# Altium schematic sheet Zasilanie_CLKDistribution.SchDoc: Zasilanie sygnału zegarowego
size A3; Organization: Altium Limited; Address1: L3, 12a Rodborough Rd; Address2: Frenchs Forest; Address3: NSW; Address4: Australia 2086
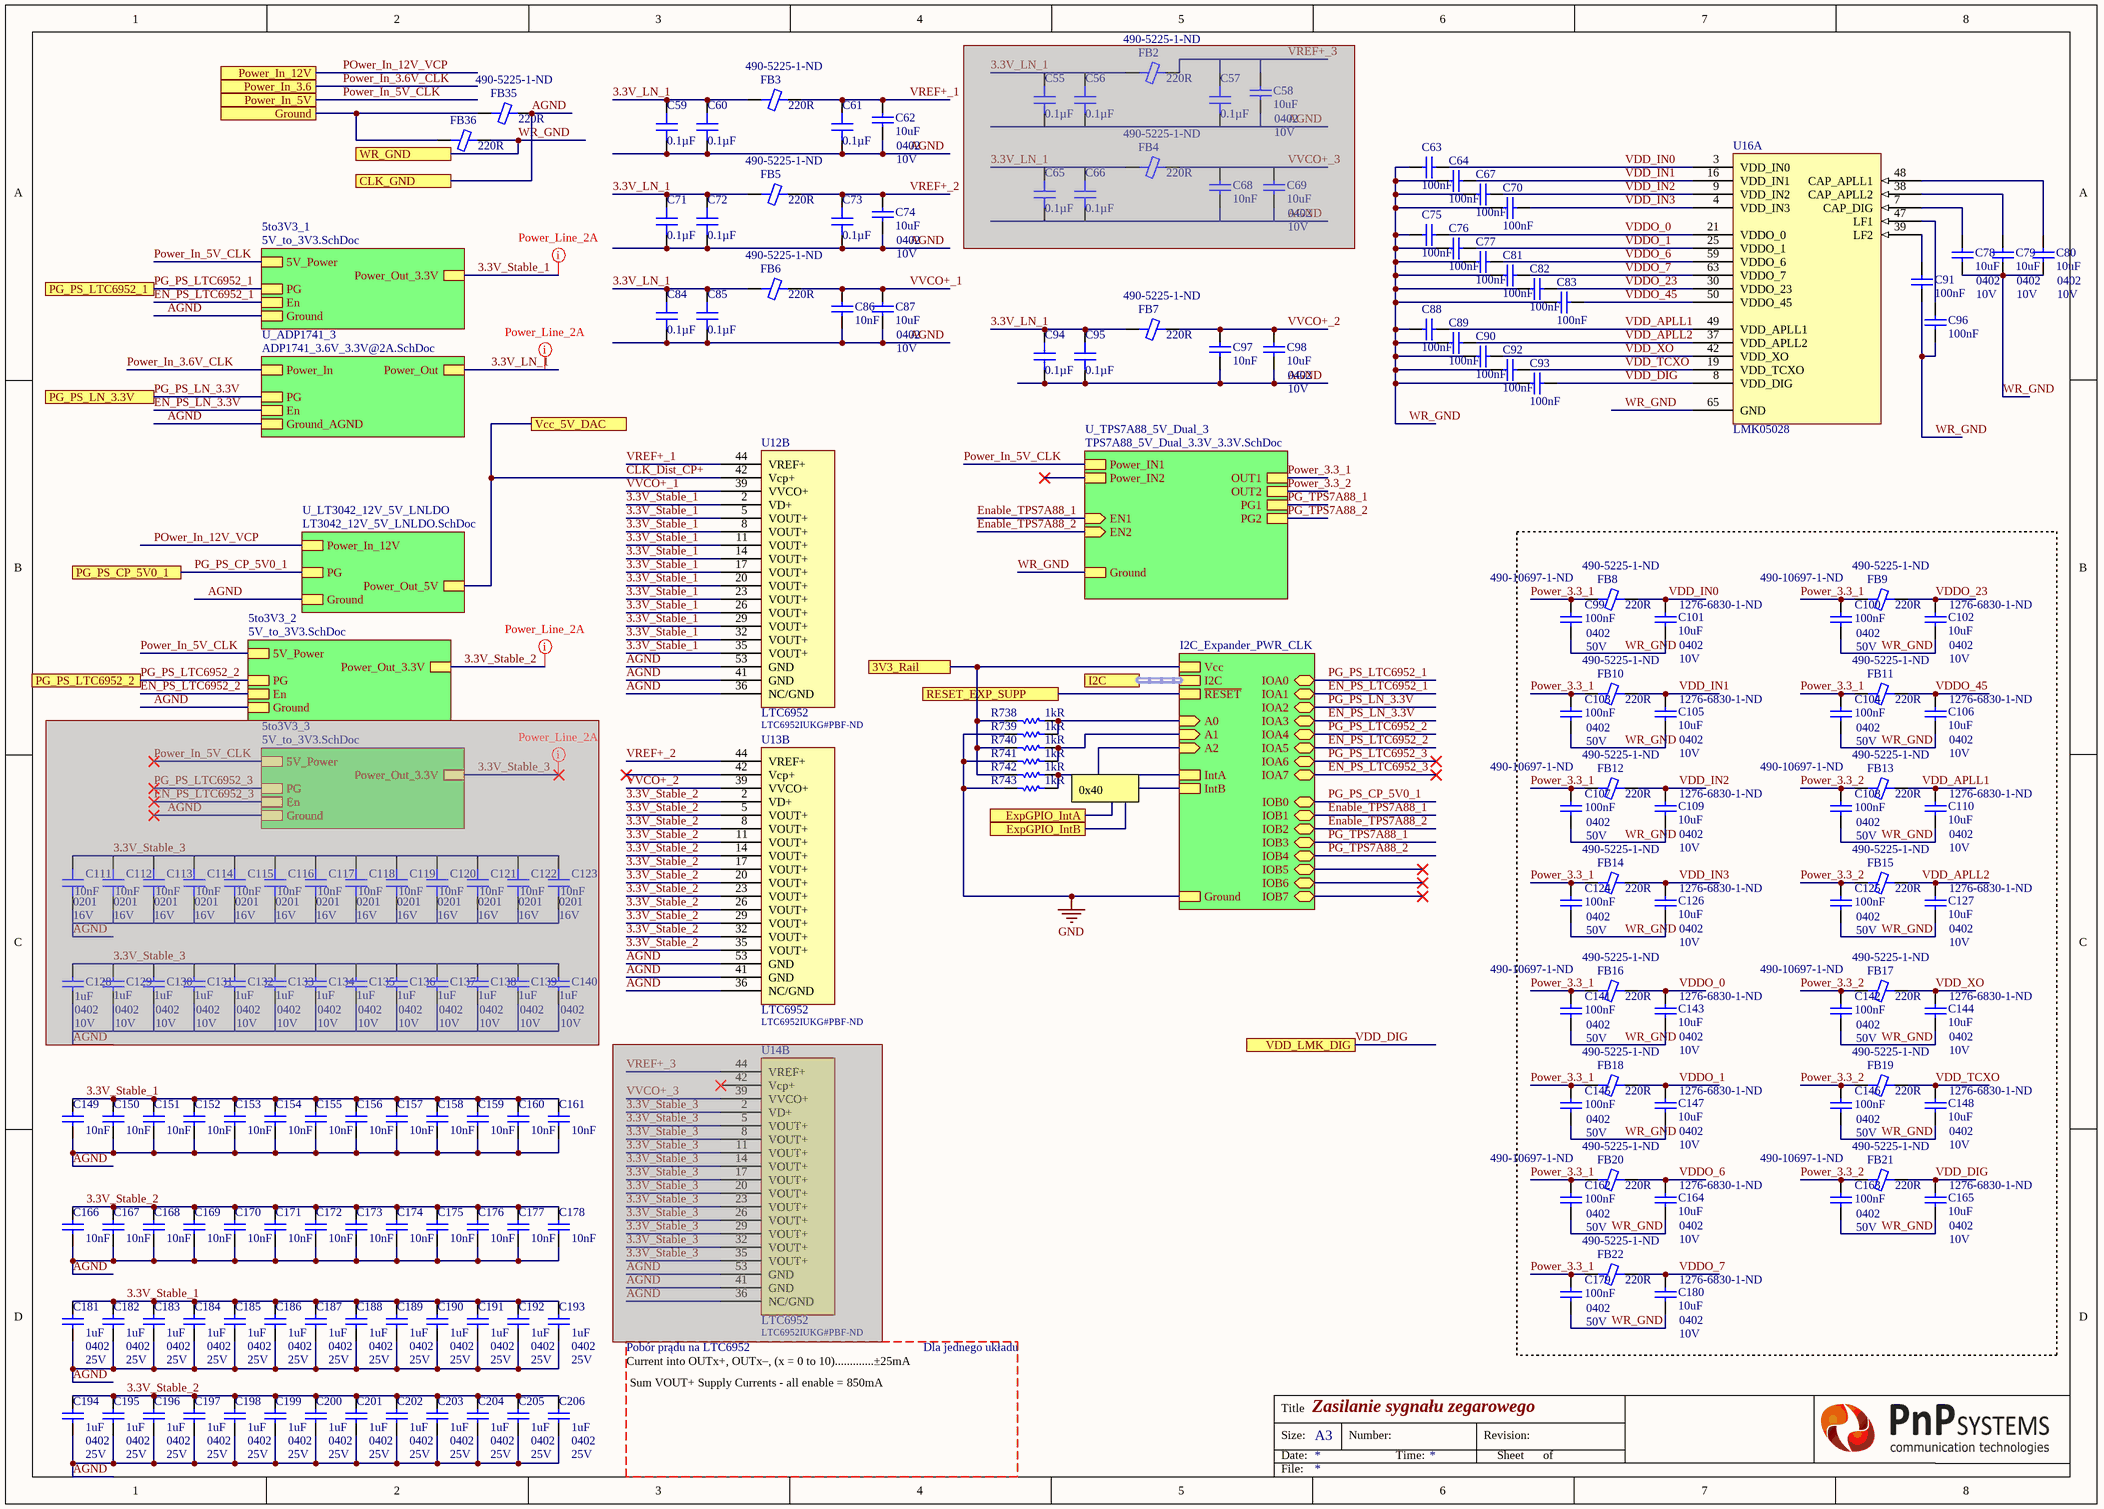
[diagram p0: Zasilanie_CLKDistribution.SchDoc]

## Parts
C55  0.1µF  [CAP 0201/0603 KK]  (masked out: inside a compile mask, not in the netlist)
C56  0.1µF  [CAP 0201/0603 KK]  (masked out: inside a compile mask, not in the netlist)
C57  0.1µF  [CAP 0201/0603 KK]  (masked out: inside a compile mask, not in the netlist)
C58  10uF  Case/Package: 0402  Voltage Rating: 10V  [CAP 0402/1005 KK]  (masked out: inside a compile mask, not in the netlist)
C59  0.1µF  [CAP 0201/0603 KK]
C60  0.1µF  [CAP 0201/0603 KK]
C61  0.1µF  [CAP 0201/0603 KK]
C62  10uF  Case/Package: 0402  Voltage Rating: 10V  [CAP 0402/1005 KK]
C63  100nF  [CAP 0402/1005 KK]
C64  100nF  [CAP 0402/1005 KK]
C65  0.1µF  [CAP 0201/0603 KK]  (masked out: inside a compile mask, not in the netlist)
C66  0.1µF  [CAP 0201/0603 KK]  (masked out: inside a compile mask, not in the netlist)
C67  100nF  [CAP 0402/1005 KK]
C68  10nF  [CAP 0201/0603 KK]  (masked out: inside a compile mask, not in the netlist)
C69  10uF  Case/Package: 0402  Voltage Rating: 10V  [CAP 0402/1005 KK]  (masked out: inside a compile mask, not in the netlist)
C70  100nF  [CAP 0402/1005 KK]
C71  0.1µF  [CAP 0201/0603 KK]
C72  0.1µF  [CAP 0201/0603 KK]
C73  0.1µF  [CAP 0201/0603 KK]
C74  10uF  Case/Package: 0402  Voltage Rating: 10V  [CAP 0402/1005 KK]
C75  100nF  [CAP 0402/1005 KK]
C76  100nF  [CAP 0402/1005 KK]
C77  100nF  [CAP 0402/1005 KK]
C78  10uF  Case/Package: 0402  Voltage Rating: 10V  [CAP 0402/1005 KK]
C79  10uF  Case/Package: 0402  Voltage Rating: 10V  [CAP 0402/1005 KK]
C80  10uF  Case/Package: 0402  Voltage Rating: 10V  [CAP 0402/1005 KK]
C81  100nF  [CAP 0402/1005 KK]
C82  100nF  [CAP 0402/1005 KK]
C83  100nF  [CAP 0402/1005 KK]
C84  0.1µF  [CAP 0201/0603 KK]
C85  0.1µF  [CAP 0201/0603 KK]
C86  10nF  [CAP 0201/0603 KK]
C87  10uF  Case/Package: 0402  Voltage Rating: 10V  [CAP 0402/1005 KK]
C88  100nF  [CAP 0402/1005 KK]
C89  100nF  [CAP 0402/1005 KK]
C90  100nF  [CAP 0402/1005 KK]
C91  100nF  [CAP 0402/1005 KK]
C92  100nF  [CAP 0402/1005 KK]
C93  100nF  [CAP 0402/1005 KK]
C94  0.1µF  [CAP 0201/0603 KK]
C95  0.1µF  [CAP 0201/0603 KK]
C96  100nF  [CAP 0402/1005 KK]
C97  10nF  [CAP 0201/0603 KK]
C98  10uF  Case/Package: 0402  Voltage Rating: 10V  [CAP 0402/1005 KK]
C99  100nF  Supplier Part Number 1: 490-10697-1-ND  Case Code (Imperial): 0402  Voltage: 50V  [CAP 0402/1005 KK]
C100  100nF  Supplier Part Number 1: 490-10697-1-ND  Case Code (Imperial): 0402  Voltage: 50V  [CAP 0402/1005 KK]
C101  10uF  Supplier Part Number 1: 1276-6830-1-ND  Case/Package: 0402  Voltage Rating: 10V  [CAP 0402/1005 KK]
C102  10uF  Supplier Part Number 1: 1276-6830-1-ND  Case/Package: 0402  Voltage Rating: 10V  [CAP 0402/1005 KK]
C103  100nF  Case Code (Imperial): 0402  Voltage: 50V  [CAP 0402/1005 KK]
C104  100nF  Case Code (Imperial): 0402  Voltage: 50V  [CAP 0402/1005 KK]
C105  10uF  Supplier Part Number 1: 1276-6830-1-ND  Case/Package: 0402  Voltage Rating: 10V  [CAP 0402/1005 KK]
C106  10uF  Supplier Part Number 1: 1276-6830-1-ND  Case/Package: 0402  Voltage Rating: 10V  [CAP 0402/1005 KK]
C107  100nF  Supplier Part Number 1: 490-10697-1-ND  Case Code (Imperial): 0402  Voltage: 50V  [CAP 0402/1005 KK]
C108  100nF  Supplier Part Number 1: 490-10697-1-ND  Case Code (Imperial): 0402  Voltage: 50V  [CAP 0402/1005 KK]
C109  10uF  Supplier Part Number 1: 1276-6830-1-ND  Case/Package: 0402  Voltage Rating: 10V  [CAP 0402/1005 KK]
C110  10uF  Supplier Part Number 1: 1276-6830-1-ND  Case/Package: 0402  Voltage Rating: 10V  [CAP 0402/1005 KK]
C111  10nF  Case Code (Imperial): 0201  Voltage Rating (DC): 16V  [CAP 0201/0603 KK]  (masked out: inside a compile mask, not in the netlist)
C112  10nF  Case Code (Imperial): 0201  Voltage Rating (DC): 16V  [CAP 0201/0603 KK]  (masked out: inside a compile mask, not in the netlist)
C113  10nF  Case Code (Imperial): 0201  Voltage Rating (DC): 16V  [CAP 0201/0603 KK]  (masked out: inside a compile mask, not in the netlist)
C114  10nF  Case Code (Imperial): 0201  Voltage Rating (DC): 16V  [CAP 0201/0603 KK]  (masked out: inside a compile mask, not in the netlist)
C115  10nF  Case Code (Imperial): 0201  Voltage Rating (DC): 16V  [CAP 0201/0603 KK]  (masked out: inside a compile mask, not in the netlist)
C116  10nF  Case Code (Imperial): 0201  Voltage Rating (DC): 16V  [CAP 0201/0603 KK]  (masked out: inside a compile mask, not in the netlist)
C117  10nF  Case Code (Imperial): 0201  Voltage Rating (DC): 16V  [CAP 0201/0603 KK]  (masked out: inside a compile mask, not in the netlist)
C118  10nF  Case Code (Imperial): 0201  Voltage Rating (DC): 16V  [CAP 0201/0603 KK]  (masked out: inside a compile mask, not in the netlist)
C119  10nF  Case Code (Imperial): 0201  Voltage Rating (DC): 16V  [CAP 0201/0603 KK]  (masked out: inside a compile mask, not in the netlist)
C120  10nF  Case Code (Imperial): 0201  Voltage Rating (DC): 16V  [CAP 0201/0603 KK]  (masked out: inside a compile mask, not in the netlist)
C121  10nF  Case Code (Imperial): 0201  Voltage Rating (DC): 16V  [CAP 0201/0603 KK]  (masked out: inside a compile mask, not in the netlist)
C122  10nF  Case Code (Imperial): 0201  Voltage Rating (DC): 16V  [CAP 0201/0603 KK]  (masked out: inside a compile mask, not in the netlist)
C123  10nF  Case Code (Imperial): 0201  Voltage Rating (DC): 16V  [CAP 0201/0603 KK]  (masked out: inside a compile mask, not in the netlist)
C124  100nF  Case Code (Imperial): 0402  Voltage: 50V  [CAP 0402/1005 KK]
C125  100nF  Case Code (Imperial): 0402  Voltage: 50V  [CAP 0402/1005 KK]
C126  10uF  Supplier Part Number 1: 1276-6830-1-ND  Case/Package: 0402  Voltage Rating: 10V  [CAP 0402/1005 KK]
C127  10uF  Supplier Part Number 1: 1276-6830-1-ND  Case/Package: 0402  Voltage Rating: 10V  [CAP 0402/1005 KK]
C128  1uF  Case Code (Imperial): 0402  Voltage Rating: 10V  [CAP 0402/1005 KK]  (masked out: inside a compile mask, not in the netlist)
C129  1uF  Case Code (Imperial): 0402  Voltage Rating: 10V  [CAP 0402/1005 KK]  (masked out: inside a compile mask, not in the netlist)
C130  1uF  Case Code (Imperial): 0402  Voltage Rating: 10V  [CAP 0402/1005 KK]  (masked out: inside a compile mask, not in the netlist)
C131  1uF  Case Code (Imperial): 0402  Voltage Rating: 10V  [CAP 0402/1005 KK]  (masked out: inside a compile mask, not in the netlist)
C132  1uF  Case Code (Imperial): 0402  Voltage Rating: 10V  [CAP 0402/1005 KK]  (masked out: inside a compile mask, not in the netlist)
C133  1uF  Case Code (Imperial): 0402  Voltage Rating: 10V  [CAP 0402/1005 KK]  (masked out: inside a compile mask, not in the netlist)
C134  1uF  Case Code (Imperial): 0402  Voltage Rating: 10V  [CAP 0402/1005 KK]  (masked out: inside a compile mask, not in the netlist)
C135  1uF  Case Code (Imperial): 0402  Voltage Rating: 10V  [CAP 0402/1005 KK]  (masked out: inside a compile mask, not in the netlist)
C136  1uF  Case Code (Imperial): 0402  Voltage Rating: 10V  [CAP 0402/1005 KK]  (masked out: inside a compile mask, not in the netlist)
C137  1uF  Case Code (Imperial): 0402  Voltage Rating: 10V  [CAP 0402/1005 KK]  (masked out: inside a compile mask, not in the netlist)
C138  1uF  Case Code (Imperial): 0402  Voltage Rating: 10V  [CAP 0402/1005 KK]  (masked out: inside a compile mask, not in the netlist)
C139  1uF  Case Code (Imperial): 0402  Voltage Rating: 10V  [CAP 0402/1005 KK]  (masked out: inside a compile mask, not in the netlist)
C140  1uF  Case Code (Imperial): 0402  Voltage Rating: 10V  [CAP 0402/1005 KK]  (masked out: inside a compile mask, not in the netlist)
C141  100nF  Supplier Part Number 1: 490-10697-1-ND  Case Code (Imperial): 0402  Voltage: 50V  [CAP 0402/1005 KK]
C142  100nF  Supplier Part Number 1: 490-10697-1-ND  Case Code (Imperial): 0402  Voltage: 50V  [CAP 0402/1005 KK]
C143  10uF  Supplier Part Number 1: 1276-6830-1-ND  Case/Package: 0402  Voltage Rating: 10V  [CAP 0402/1005 KK]
C144  10uF  Supplier Part Number 1: 1276-6830-1-ND  Case/Package: 0402  Voltage Rating: 10V  [CAP 0402/1005 KK]
C145  100nF  Case Code (Imperial): 0402  Voltage: 50V  [CAP 0402/1005 KK]
C146  100nF  Case Code (Imperial): 0402  Voltage: 50V  [CAP 0402/1005 KK]
C147  10uF  Supplier Part Number 1: 1276-6830-1-ND  Case/Package: 0402  Voltage Rating: 10V  [CAP 0402/1005 KK]
C148  10uF  Supplier Part Number 1: 1276-6830-1-ND  Case/Package: 0402  Voltage Rating: 10V  [CAP 0402/1005 KK]
C149  10nF  [CAP 0201/0603 KK]
C150  10nF  [CAP 0201/0603 KK]
C151  10nF  [CAP 0201/0603 KK]
C152  10nF  [CAP 0201/0603 KK]
C153  10nF  [CAP 0201/0603 KK]
C154  10nF  [CAP 0201/0603 KK]
C155  10nF  [CAP 0201/0603 KK]
C156  10nF  [CAP 0201/0603 KK]
C157  10nF  [CAP 0201/0603 KK]
C158  10nF  [CAP 0201/0603 KK]
C159  10nF  [CAP 0201/0603 KK]
C160  10nF  [CAP 0201/0603 KK]
C161  10nF  [CAP 0201/0603 KK]
C162  100nF  Supplier Part Number 1: 490-10697-1-ND  Case Code (Imperial): 0402  Voltage: 50V  [CAP 0402/1005 KK]
C163  100nF  Supplier Part Number 1: 490-10697-1-ND  Case Code (Imperial): 0402  Voltage: 50V  [CAP 0402/1005 KK]
C164  10uF  Supplier Part Number 1: 1276-6830-1-ND  Case/Package: 0402  Voltage Rating: 10V  [CAP 0402/1005 KK]
C165  10uF  Supplier Part Number 1: 1276-6830-1-ND  Case/Package: 0402  Voltage Rating: 10V  [CAP 0402/1005 KK]
C166  10nF  [CAP 0201/0603 KK]
C167  10nF  [CAP 0201/0603 KK]
C168  10nF  [CAP 0201/0603 KK]
C169  10nF  [CAP 0201/0603 KK]
C170  10nF  [CAP 0201/0603 KK]
C171  10nF  [CAP 0201/0603 KK]
C172  10nF  [CAP 0201/0603 KK]
C173  10nF  [CAP 0201/0603 KK]
C174  10nF  [CAP 0201/0603 KK]
C175  10nF  [CAP 0201/0603 KK]
C176  10nF  [CAP 0201/0603 KK]
C177  10nF  [CAP 0201/0603 KK]
C178  10nF  [CAP 0201/0603 KK]
C179  100nF  Case Code (Imperial): 0402  Voltage: 50V  [CAP 0402/1005 KK]
C180  10uF  Supplier Part Number 1: 1276-6830-1-ND  Case/Package: 0402  Voltage Rating: 10V  [CAP 0402/1005 KK]
C181  1uF  Case/Package: 0402  Voltage Rating: 25V  [CAP 0402/1005 KK]
C182  1uF  Case/Package: 0402  Voltage Rating: 25V  [CAP 0402/1005 KK]
C183  1uF  Case/Package: 0402  Voltage Rating: 25V  [CAP 0402/1005 KK]
C184  1uF  Case/Package: 0402  Voltage Rating: 25V  [CAP 0402/1005 KK]
C185  1uF  Case/Package: 0402  Voltage Rating: 25V  [CAP 0402/1005 KK]
C186  1uF  Case/Package: 0402  Voltage Rating: 25V  [CAP 0402/1005 KK]
C187  1uF  Case/Package: 0402  Voltage Rating: 25V  [CAP 0402/1005 KK]
C188  1uF  Case/Package: 0402  Voltage Rating: 25V  [CAP 0402/1005 KK]
C189  1uF  Case/Package: 0402  Voltage Rating: 25V  [CAP 0402/1005 KK]
C190  1uF  Case/Package: 0402  Voltage Rating: 25V  [CAP 0402/1005 KK]
C191  1uF  Case/Package: 0402  Voltage Rating: 25V  [CAP 0402/1005 KK]
C192  1uF  Case/Package: 0402  Voltage Rating: 25V  [CAP 0402/1005 KK]
C193  1uF  Case/Package: 0402  Voltage Rating: 25V  [CAP 0402/1005 KK]
C194  1uF  Case/Package: 0402  Voltage Rating: 25V  [CAP 0402/1005 KK]
C195  1uF  Case/Package: 0402  Voltage Rating: 25V  [CAP 0402/1005 KK]
C196  1uF  Case/Package: 0402  Voltage Rating: 25V  [CAP 0402/1005 KK]
C197  1uF  Case/Package: 0402  Voltage Rating: 25V  [CAP 0402/1005 KK]
C198  1uF  Case/Package: 0402  Voltage Rating: 25V  [CAP 0402/1005 KK]
C199  1uF  Case/Package: 0402  Voltage Rating: 25V  [CAP 0402/1005 KK]
C200  1uF  Case/Package: 0402  Voltage Rating: 25V  [CAP 0402/1005 KK]
C201  1uF  Case/Package: 0402  Voltage Rating: 25V  [CAP 0402/1005 KK]
C202  1uF  Case/Package: 0402  Voltage Rating: 25V  [CAP 0402/1005 KK]
C203  1uF  Case/Package: 0402  Voltage Rating: 25V  [CAP 0402/1005 KK]
C204  1uF  Case/Package: 0402  Voltage Rating: 25V  [CAP 0402/1005 KK]
C205  1uF  Case/Package: 0402  Voltage Rating: 25V  [CAP 0402/1005 KK]
C206  1uF  Case/Package: 0402  Voltage Rating: 25V  [CAP 0402/1005 KK]
FB2  220R  Supplier Part Number 1: 490-5225-1-ND  [FER 0603/1608]  (masked out: inside a compile mask, not in the netlist)
FB3  220R  Supplier Part Number 1: 490-5225-1-ND  [FER 0603/1608]
FB4  220R  Supplier Part Number 1: 490-5225-1-ND  [FER 0603/1608]  (masked out: inside a compile mask, not in the netlist)
FB5  220R  Supplier Part Number 1: 490-5225-1-ND  [FER 0603/1608]
FB6  220R  Supplier Part Number 1: 490-5225-1-ND  [FER 0603/1608]
FB7  220R  Supplier Part Number 1: 490-5225-1-ND  [FER 0603/1608]
FB8  220R  Supplier Part Number 1: 490-5225-1-ND  [FER 0603/1608]
FB9  220R  Supplier Part Number 1: 490-5225-1-ND  [FER 0603/1608]
FB10  220R  Supplier Part Number 1: 490-5225-1-ND  [FER 0603/1608]
FB11  220R  Supplier Part Number 1: 490-5225-1-ND  [FER 0603/1608]
FB12  220R  Supplier Part Number 1: 490-5225-1-ND  [FER 0603/1608]
FB13  220R  Supplier Part Number 1: 490-5225-1-ND  [FER 0603/1608]
FB14  220R  Supplier Part Number 1: 490-5225-1-ND  [FER 0603/1608]
FB15  220R  Supplier Part Number 1: 490-5225-1-ND  [FER 0603/1608]
FB16  220R  Supplier Part Number 1: 490-5225-1-ND  [FER 0603/1608]
FB17  220R  Supplier Part Number 1: 490-5225-1-ND  [FER 0603/1608]
FB18  220R  Supplier Part Number 1: 490-5225-1-ND  [FER 0603/1608]
FB19  220R  Supplier Part Number 1: 490-5225-1-ND  [FER 0603/1608]
FB20  220R  Supplier Part Number 1: 490-5225-1-ND  [FER 0603/1608]
FB21  220R  Supplier Part Number 1: 490-5225-1-ND  [FER 0603/1608]
FB22  220R  Supplier Part Number 1: 490-5225-1-ND  [FER 0603/1608]
FB35  220R  Supplier Part Number 1: 490-5225-1-ND  [FER 0603/1608]
FB36  220R  [FER 0603/1608]
R738  1kR  [RES 0402/1005 RF KK]
R739  1kR  [RES 0402/1005 RF KK]
R740  1kR  [RES 0402/1005 RF KK]
R741  1kR  [RES 0402/1005 RF KK]
R742  1kR  [RES 0402/1005 RF KK]
R743  1kR  [RES 0402/1005 RF KK]
U12  LTC6952  Supplier Part Number 1: LTC6952IUKG#PBF-ND  [LTC6952]  (part B of 2)
U13  LTC6952  Supplier Part Number 1: LTC6952IUKG#PBF-ND  [LTC6952]  (part B of 2)
U14  LTC6952  Supplier Part Number 1: LTC6952IUKG#PBF-ND  [LTC6952]  (part B of 2)  (masked out: inside a compile mask, not in the netlist)
U16  LMK05028  [LMK05028]  (part A of 2)

## Sub-sheets
5to3V3_1 = 5V_to_3V3.SchDoc: Ground, PG, 5V_Power, En, Power_Out_3.3V
5to3V3_2 = 5V_to_3V3.SchDoc: Ground, PG, 5V_Power, En, Power_Out_3.3V
5to3V3_3 = 5V_to_3V3.SchDoc (masked out): Ground, PG, 5V_Power, En, Power_Out_3.3V
I2C_Expander_PWR_CLK = I2C_Expander.SchDoc: IOA7 (bidir), IOA3 (bidir), IOA6 (bidir), IOA1 (bidir), IOA0 (bidir), IOA5 (bidir), IOB1 (bidir), IOB2 (bidir), IOB5 (bidir), IOB6 (bidir), IOB7 (bidir), IntA, IntB, Ground, IOB4 (bidir), IOB3 (bidir), IOA2 (bidir), IOA4 (bidir), IOB0 (bidir), Vcc, ~{RESET}, I2C (harness I2C), A2 (in), A1 (in), A0 (in)
U_ADP1741_3 = ADP1741_3.6V_3.3V@2A.SchDoc: Power_Out, PG, En, Power_In, Ground_AGND
U_LT3042_12V_5V_LNLDO = LT3042_12V_5V_LNLDO.SchDoc: Power_In_12V, Ground, PG, Power_Out_5V
U_TPS7A88_5V_Dual_3 = TPS7A88_5V_Dual_3.3V_3.3V.SchDoc: Power_IN1, Power_IN2, Ground, EN1 (in), EN2 (in), PG1, PG2, OUT1, OUT2  | Noise: LOW_NOISE

## Ports
3V3_Rail, CLK_GND, ExpGPIO_IntA, ExpGPIO_IntB, Ground, I2C (harness I2C), PG_PS_CP_5V0_1, PG_PS_LN_3.3V, PG_PS_LTC6952_1, PG_PS_LTC6952_2, Power_In_3.6, Power_In_5V, Power_In_12V, RESET_EXP_SUPP, Vcc_5V_DAC, VDD_LMK_DIG, WR_GND

## Nets
GND: R739.1 R741.1 R743.1 ; sheet I2C_Expander_PWR_CLK/Ground
3.3V_LN_1: C59.2 C60.2 C71.2 C72.2 C84.2 C85.2 C94.2 C95.2 FB3.1 FB5.1 FB6.1 FB7.1 ; sheet U_ADP1741_3/Power_Out
3.3V_Stable_1: C149.2 C150.2 C151.2 C152.2 C153.2 C154.2 C155.2 C156.2 C157.2 C158.2 C159.2 C160.2 C161.2 C181.1 C182.1 C183.1 C184.1 C185.1 C186.1 C187.1 C188.1 C189.1 C190.1 C191.1 C192.1 C193.1 U12.2(VD+) U12.5(VOUT+) U12.8(VOUT+) U12.11(VOUT+) U12.14(VOUT+) U12.17(VOUT+) U12.20(VOUT+) U12.23(VOUT+) U12.26(VOUT+) U12.29(VOUT+) U12.32(VOUT+) U12.35(VOUT+) ; sheet 5to3V3_1/Power_Out_3.3V
3.3V_Stable_2: C166.2 C167.2 C168.2 C169.2 C170.2 C171.2 C172.2 C173.2 C174.2 C175.2 C176.2 C177.2 C178.2 C194.1 C195.1 C196.1 C197.1 C198.1 C199.1 C200.1 C201.1 C202.1 C203.1 C204.1 C205.1 C206.1 U13.2(VD+) U13.5(VOUT+) U13.8(VOUT+) U13.11(VOUT+) U13.14(VOUT+) U13.17(VOUT+) U13.20(VOUT+) U13.23(VOUT+) U13.26(VOUT+) U13.29(VOUT+) U13.32(VOUT+) U13.35(VOUT+) ; sheet 5to3V3_2/Power_Out_3.3V
3V3_Rail: R738.1 R740.1 R742.1 ; port 3V3_Rail, sheet I2C_Expander_PWR_CLK/Vcc
AGND: C59.1 C60.1 C61.1 C62.1 C71.1 C72.1 C73.1 C74.1 C84.1 C85.1 C86.1 C87.1 C94.1 C95.1 C97.1 C98.1 C149.1 C150.1 C151.1 C152.1 C153.1 C154.1 C155.1 C156.1 C157.1 C158.1 C159.1 C160.1 C161.1 C166.1 C167.1 C168.1 C169.1 C170.1 C171.1 C172.1 C173.1 C174.1 C175.1 C176.1 C177.1 C178.1 C181.2 C182.2 C183.2 C184.2 C185.2 C186.2 C187.2 C188.2 C189.2 C190.2 C191.2 C192.2 C193.2 C194.2 C195.2 C196.2 C197.2 C198.2 C199.2 C200.2 C201.2 C202.2 C203.2 C204.2 C205.2 C206.2 FB35.2 U12.36(NC/GND) U12.41(GND) U12.53(GND) U13.36(NC/GND) U13.41(GND) U13.53(GND) ; port CLK_GND, sheet U_ADP1741_3/Ground_AGND, sheet 5to3V3_1/Ground, sheet 5to3V3_2/Ground, sheet U_LT3042_12V_5V_LNLDO/Ground
CLK_Dist_CP+: U12.42(Vcp+) ; port Vcc_5V_DAC, sheet U_LT3042_12V_5V_LNLDO/Power_Out_5V
EN_PS_LN_3.3V: sheet U_ADP1741_3/En, sheet I2C_Expander_PWR_CLK/IOA3
EN_PS_LTC6952_1: sheet 5to3V3_1/En, sheet I2C_Expander_PWR_CLK/IOA1
EN_PS_LTC6952_2: sheet 5to3V3_2/En, sheet I2C_Expander_PWR_CLK/IOA5
EN_PS_LTC6952_3: sheet I2C_Expander_PWR_CLK/IOA7
Enable_TPS7A88_1: sheet U_TPS7A88_5V_Dual_3/EN1, sheet I2C_Expander_PWR_CLK/IOB1
Enable_TPS7A88_2: sheet U_TPS7A88_5V_Dual_3/EN2, sheet I2C_Expander_PWR_CLK/IOB2
ExpGPIO_IntA: port ExpGPIO_IntA, sheet I2C_Expander_PWR_CLK/IntA
ExpGPIO_IntB: port ExpGPIO_IntB, sheet I2C_Expander_PWR_CLK/IntB
Ground: FB35.1 FB36.1 ; port Ground
PG_PS_CP_5V0_1: port PG_PS_CP_5V0_1, sheet U_LT3042_12V_5V_LNLDO/PG, sheet I2C_Expander_PWR_CLK/IOB0
PG_PS_LN_3.3V: port PG_PS_LN_3.3V, sheet U_ADP1741_3/PG, sheet I2C_Expander_PWR_CLK/IOA2
PG_PS_LTC6952_1: port PG_PS_LTC6952_1, sheet 5to3V3_1/PG, sheet I2C_Expander_PWR_CLK/IOA0
PG_PS_LTC6952_2: port PG_PS_LTC6952_2, sheet 5to3V3_2/PG, sheet I2C_Expander_PWR_CLK/IOA4
PG_PS_LTC6952_3: sheet I2C_Expander_PWR_CLK/IOA6
PG_TPS7A88_1: sheet U_TPS7A88_5V_Dual_3/PG1, sheet I2C_Expander_PWR_CLK/IOB3
PG_TPS7A88_2: sheet U_TPS7A88_5V_Dual_3/PG2, sheet I2C_Expander_PWR_CLK/IOB4
Power_3.3_1: C99.2 C100.2 C103.2 C104.2 C107.2 C124.2 C141.2 C145.2 C162.2 C179.2 FB8.1 FB9.1 FB10.1 FB11.1 FB12.1 FB14.1 FB16.1 FB18.1 FB20.1 FB22.1 ; sheet U_TPS7A88_5V_Dual_3/OUT1
Power_3.3_2: C108.2 C125.2 C142.2 C146.2 C163.2 FB13.1 FB15.1 FB17.1 FB19.1 FB21.1 ; sheet U_TPS7A88_5V_Dual_3/OUT2
Power_In_3.6V_CLK: port Power_In_3.6, sheet U_ADP1741_3/Power_In
Power_In_5V_CLK: port Power_In_5V, sheet 5to3V3_1/5V_Power, sheet 5to3V3_2/5V_Power, sheet U_TPS7A88_5V_Dual_3/Power_IN1
POwer_In_12V_VCP: port Power_In_12V, sheet U_LT3042_12V_5V_LNLDO/Power_In_12V
RESET_EXP_SUPP: port RESET_EXP_SUPP, sheet I2C_Expander_PWR_CLK/~{RESET}
VDD_APLL1: C88.1 C110.2 FB13.2 U16.49(VDD_APLL1)
VDD_APLL2: C89.1 C127.2 FB15.2 U16.37(VDD_APLL2)
VDD_DIG: C93.1 C165.2 FB21.2 U16.8(VDD_DIG) ; port VDD_LMK_DIG
VDD_IN0: C63.1 C101.2 FB8.2 U16.3(VDD_IN0)
VDD_IN1: C64.1 C105.2 FB10.2 U16.16(VDD_IN1)
VDD_IN2: C67.1 C109.2 FB12.2 U16.9(VDD_IN2)
VDD_IN3: C70.1 C126.2 FB14.2 U16.4(VDD_IN3)
VDD_TCXO: C92.1 C148.2 FB19.2 U16.19(VDD_TCXO)
VDD_XO: C90.1 C144.2 FB17.2 U16.42(VDD_XO)
VDDO_0: C75.1 C143.2 FB16.2 U16.21(VDDO_0)
VDDO_1: C76.1 C147.2 FB18.2 U16.25(VDDO_1)
VDDO_6: C77.1 C164.2 FB20.2 U16.59(VDDO_6)
VDDO_7: C81.1 C180.2 FB22.2 U16.63(VDDO_7)
VDDO_23: C82.1 C102.2 FB9.2 U16.30(VDDO_23)
VDDO_45: C83.1 C106.2 FB11.2 U16.50(VDDO_45)
VREF+_1: C61.2 C62.2 FB3.2 U12.44(VREF+)
VREF+_2: C73.2 C74.2 FB5.2 U13.44(VREF+)
VVCO+_1: C86.2 C87.2 FB6.2 U12.39(VVCO+)
VVCO+_2: C97.2 C98.2 FB7.2 U13.39(VVCO+)
WR_GND: C63.2 C64.2 C67.2 C70.2 C75.2 C76.2 C77.2 C78.1 C79.1 C80.1 C81.2 C82.2 C83.2 C88.2 C89.2 C90.2 C91.2 C92.2 C93.2 C96.2 C99.1 C100.1 C101.1 C102.1 C103.1 C104.1 C105.1 C106.1 C107.1 C108.1 C109.1 C110.1 C124.1 C125.1 C126.1 C127.1 C141.1 C142.1 C143.1 C144.1 C145.1 C146.1 C147.1 C148.1 C162.1 C163.1 C164.1 C165.1 C179.1 C180.1 FB36.2 U16.65(GND) ; port WR_GND, sheet U_TPS7A88_5V_Dual_3/Ground
NetC78_2: C78.2 U16.7(CAP_DIG)
NetC79_2: C79.2 U16.38(CAP_APLL2)
NetC80_2: C80.2 U16.48(CAP_APLL1)
NetC91_1: C91.1 U16.39(LF2)
NetC96_1: C96.1 U16.47(LF1)
NetR738_2: R738.2 R739.2 ; sheet I2C_Expander_PWR_CLK/A0
NetR740_2: R740.2 R741.2 ; sheet I2C_Expander_PWR_CLK/A1
NetR742_2: R742.2 R743.2 ; sheet I2C_Expander_PWR_CLK/A2

Not connected (* = marked no-connect by the designer): U13 42(Vcp+)*

## Buses and harness runs
harness port I2C = sheet I2C_Expander_PWR_CLK/I2C

## Layout directives
net class Power_Line_2A: 3.3V_LN_1, 3.3V_Stable_1, 3.3V_Stable_2, (no net found under the mark)

## Notes on the sheet
- 0x40
- Current into OUTx+, OUTx–, (x = 0 to 10).............±25mA
- (near U14) Pobór prądu na LTC6952
- Sum VOUT+ Supply Currents - all enable = 850mA
- Dla jednego układu
- Title
- Size:
- Date:
- A3
- Number:
- Time:
- Revision:
- Sheet
- of
- File:

## Library data of the parts
C55-C57 C59-C61 C65 C66 C71-C73 C84 C85 C94 C95 = Capacitor: SMT Capacitor; Part Number: GRM033R61C104ME84D; Value: 0.1µF; Supplier 1: Digi-Key; Supplier Part Number 1: 490-9986-1-ND
C58 C62 C69 C74 C78-C80 C87 C98 C101 C102 C105 C106 C109 C110 C126 C127 C143 C144 C147 C148 C164 C165 C180 = Capacitor: CAP CER 10UF 10V X5R 0402; Manufacturer: Samsung; Manufacturer Part Number: CL05A106MP8NUB8; Tolerance: 20%; Supplier 1: Digi-Key; RoHS: Yes; Category: Ceramic Capacitors; Stock 1: 996737; Pricing 1: 1=0,47000, 10=0,32400, 100=0,19410, 500=0,14558, 1000=0,12293, 2500=0,11646 (USD); Mount: Surface Mount; Case Code (Metric): 1005; Case Code (Imperial): 0402; Min Operating Temperature: -55°C; Max Operating Temperature: 85°C; Packaging: Tape and Reel; Capacitance: 10uF; Length: 0.039inch; Width: 0.02inch; Thickness: 0.035inch; ComponentLink1URL: http://www.samsungsem.com/kr/support/product-search/mlcc/CL05A106MP8NUB8.jsp?src-supplier=Digi-Key; ComponentLink1Description: http://www.samsungsem.com/kr/support/product-search/mlcc/CL05A106MP8NUB8.jsp?src-supplier=Digi-Key
  C58 C62 C69 C74 C78-C80 C87 C98: Supplier Part Number 1: 1276-6830-1-ND
C63 C64 C67 C70 C75-C77 C81-C83 C88-C93 C96 C99 C100 C103 C104 C107 C108 C124 C125 C141 C142 C145 C146 C162 C163 C179 = Capacitor: CAP CER 0.1UF 50V X5R 0402; Manufacturer: Murata; Manufacturer Part Number: GRM155R61H104KE14D; Dielectric Material: Ceramic; Dissipation Factor: 0.025%; Tolerance: 10%; Supplier 1: Digi-Key; RoHS: Yes; Category: Ceramic Capacitors; Stock 1: 435607; Pricing 1: 1=0,10000, 10=0,04600, 100=0,02050, 500=0,01464, 1000=0,01150, 2500=0,01045, 5000=0,00961 (USD); Mount: Surface Mount; Case/Package: 0402; Weight: 0.000212oz; Case Code (Metric): 1005; Min Operating Temperature: -55°C; Max Operating Temperature: 85°C; Capacitance: 100nF; Packaging: Tape and Reel; Voltage Rating: 50V; Dielectric: X5R; Termination: SMD/SMT; Composition: Ceramic; Voltage Rating (DC): 50V; Package Quantity: 10000; Length: 1mm; Height: 0.5mm; Width: 0.02inch; Thickness: 0.022inch; Depth: 0.5mm; REACH SVHC: No SVHC; Lead Free: Lead Free; ComponentLink1URL: http://www.farnell.com/datasheets/2079150.pdf?src-supplier=Farnell; ComponentLink1Description: http://www.farnell.com/datasheets/2079150.pdf?src-supplier=Farnell; ComponentLink2URL: http://www.mouser.com/ds/2/281/c02e-2905.pdf?src-supplier=Mouser; ComponentLink2Description: http://www.mouser.com/ds/2/281/c02e-2905.pdf?src-supplier=Mouser; ComponentLink3URL: http://www.farnell.com/datasheets/2079150.pdf?src-supplier=Element14; ComponentLink3Description: http://www.farnell.com/datasheets/2079150.pdf?src-supplier=Element14; ComponentLink4URL: http://search.murata.co.jp/Ceramy/image/img/A01X/G101/ENG/GRM155R61H104KE14-01.pdf?src-supplier=Digi-Key; ComponentLink4Description: http://search.murata.co.jp/Ceramy/image/img/A01X/G101/ENG/GRM155R61H104KE14-01.pdf?src-supplier=Digi-Key
  C63 C64 C67 C70 C75-C77 C81-C83 C88-C93 C96: Supplier Part Number 1: 490-10697-1-ND; Case Code (Imperial): 0402; Voltage: 50V
  C103 C104 C124 C125 C145 C146 C179: Supplier Part Number 1: 490-10697-1-ND
C68 C86 C97 C149-C161 C166-C178 = Capacitor: CAP CER 10000PF 16V X7R 0201; Manufacturer: Murata; Manufacturer Part Number: GRM033R71C103KE14D; Tolerance: 10%; Supplier 1: Digi-Key; Supplier Part Number 1: 490-14453-1-ND; RoHS: No; Category: Ceramic Capacitors; Stock 1: 188777; Pricing 1: 1=0,10000, 10=0,01900, 100=0,00870, 500=0,00620, 1000=0,00487, 2500=0,00443, 5000=0,00407 (USD); Voltage Rating (DC): 16V; Dielectric: X7R; Capacitance: 10nF; Length: 600um; Width: 300um; Thickness: 300um; ComponentLink1URL: http://www.farnell.com/datasheets/2722745.pdf?src-supplier=Farnell; ComponentLink1Description: http://www.farnell.com/datasheets/2722745.pdf?src-supplier=Farnell; ComponentLink2URL: http://www.farnell.com/datasheets/2722745.pdf?src-supplier=Newark; ComponentLink2Description: http://www.farnell.com/datasheets/2722745.pdf?src-supplier=Newark; ComponentLink3URL: http://www.farnell.com/datasheets/2722745.pdf?src-supplier=Element14; ComponentLink3Description: http://www.farnell.com/datasheets/2722745.pdf?src-supplier=Element14; ComponentLink4URL: http://search.murata.co.jp/Ceramy/image/img/A01X/G101/ENG/GRM033R71C103KE14-01.pdf?src-supplier=Digi-Key; ComponentLink4Description: http://search.murata.co.jp/Ceramy/image/img/A01X/G101/ENG/GRM033R71C103KE14-01.pdf?src-supplier=Digi-Key
C111-C123 = Capacitor: Cap Ceramic 0.01uF 16V X5R 10% SMD 0201 85C Paper T/R; Manufacturer: Yageo; Manufacturer Part Number: CC0201KRX5R7BB103; Supplier 1: Digi-Key; Supplier Part Number 1: 311-1596-1-ND; RoHS: Yes; Category: Ceramic Capacitors; Stock 1: 528309; Pricing 1: 1=0,10000, 10=0,01700, 100=0,00740, 500=0,00528, 1000=0,00415, 2500=0,00378, 5000=0,00347 (USD); Mount: Surface Mount; Case/Package: 0201; Weight: 6E-06oz; Case Code (Metric): 0603; Min Operating Temperature: -55°C; Max Operating Temperature: 85°C; Tolerance: 10%; Packaging: Tape and Reel; Capacitance: 10nF; Dielectric: X5R; Voltage Rating: 16V; Termination: SMD/SMT; Composition: Ceramic; Length: 0.024inch; Width: 0.012inch; Thickness: 0.013inch; Depth: 0.3mm; Lead Free: Lead Free; Halogen Free: Halogen Free; ComponentLink1URL: http://components.arrow.com/part/dataview/0323_04166367?src-supplier=Arrow+Europe; ComponentLink1Description: http://components.arrow.com/part/dataview/0323_04166367?src-supplier=Arrow+Europe; ComponentLink2URL: http://www.mouser.com/ds/2/447/UPY-GPHC_X5R_4V-to-50V_25-1131599.pdf?src-supplier=Mouser; ComponentLink2Description: http://www.mouser.com/ds/2/447/UPY-GPHC_X5R_4V-to-50V_25-1131599.pdf?src-supplier=Mouser; ComponentLink3URL: http://www.yageo.com/documents/recent/UPY-GPHC_X5R_4V-to-50V_25.pdf?src-supplier=Digi-Key; ComponentLink3Description: http://www.yageo.com/documents/recent/UPY-GPHC_X5R_4V-to-50V_25.pdf?src-supplier=Digi-Key
C128-C140 = Capacitor: CAP CER 1UF 10V X5R 0402; Manufacturer: Yageo; Manufacturer Part Number: CC0402KRX5R6BB105; Tolerance: 10%; Dissipation Factor: 15%; Supplier 1: Digi-Key; Supplier Part Number 1: 311-1439-1-ND; RoHS: Yes; Category: Ceramic Capacitors; Stock 1: 6047751; Pricing 1: 1=0,10000, 10=0,06300, 100=0,02790, 500=0,01996, 1000=0,01568, 2500=0,01425, 5000=0,01311 (USD); Mount: Surface Mount; Case/Package: 0402; Number of Pins: 2; Case Code (Metric): 1005; Min Operating Temperature: -55°C; Max Operating Temperature: 85°C; Package Quantity: 1; Capacitance: 1uF; Packaging: Tape and Reel; Voltage Rating (DC): 10V; Dielectric: X5R; Termination: SMD/SMT; Composition: Ceramic; Length: 1mm; Height: 0.5mm; Width: 0.02inch; Thickness: 0.022inch; Depth: 0.5mm; Radiation Hardening: No; REACH SVHC: No SVHC; Lead Free: Lead Free; Halogen Free: Halogen Free; ComponentLink1URL: https://datasheet.ciiva.com/176/upy-gphc-x5r-4v-to-50v-12-176704.pdf?src-supplier=Digi-Key; ComponentLink1Description: https://datasheet.ciiva.com/176/upy-gphc-x5r-4v-to-50v-12-176704.pdf?src-supplier=Digi-Key; ComponentLink2URL: https://datasheet.ciiva.com/176/mlccorderingcode-176705.pdf?src-supplier=Digi-Key; ComponentLink2Description: https://datasheet.ciiva.com/176/mlccorderingcode-176705.pdf?src-supplier=Digi-Key; ComponentLink3URL: https://datasheet.ciiva.com/176/mlccorderingcode-176706.pdf?src-supplier=Digi-Key; ComponentLink3Description: https://datasheet.ciiva.com/176/mlccorderingcode-176706.pdf?src-supplier=Digi-Key
C181-C206 = Capacitor: MURATA - GRT155R61E105KE01D - SMD Multilayer Ceramic Capacitor, 1 µF, 25 V, 0402 [1005 Metric], ± 10%, X5R, GRT Series - SMD Multilayer Ceramic Capacitor, 1 µF, 25 V, 0402 [1005 Metric], ± 10%, X5R, GRT Series; Supplier 1: Digi-Key; Supplier Part Number 1: 490-12263-1-ND; Manufacturer: Murata; Manufacturer Part Number: GRT155R61E105KE01D; RoHS: Yes; Category: Ceramic Capacitors; Stock 1: 341453; Pricing 1: 1=0,18000, 10=0,12300, 100=0,06210, 500=0,04248, 1000=0,03758, 2500=0,03594, 5000=0,03268 (USD); Mount: Surface Mount; Case Code (Metric): 1005; Case Code (Imperial): 0402; Min Operating Temperature: -55°C; Max Operating Temperature: 85°C; Packaging: Tape and Reel; Capacitance: 1uF; Tolerance: 10%; Dielectric: X5R; Voltage Rating (DC): 25V; Length: 0.039inch; Width: 0.02inch; Thickness: 0.022inch; Ratings: AEC-Q200; ComponentLink1URL: http://www.farnell.com/datasheets/2165918.pdf?src-supplier=Farnell; ComponentLink1Description: http://www.farnell.com/datasheets/2165918.pdf?src-supplier=Farnell; ComponentLink2URL: http://search.murata.co.jp/Ceramy/image/img/A01X/G101/ENG/GRT155R61E105KE01-01.pdf?src-supplier=Digi-Key; ComponentLink2Description: http://search.murata.co.jp/Ceramy/image/img/A01X/G101/ENG/GRT155R61E105KE01-01.pdf?src-supplier=Digi-Key; ComponentLink3URL: http://www.farnell.com/datasheets/2165918.pdf?src-supplier=Element14; ComponentLink3Description: http://www.farnell.com/datasheets/2165918.pdf?src-supplier=Element14
FB2-FB22 FB35 FB36 = Ferrite: FERRITE BEAD 220 OHM 0603 1LN; Manufacturer: Murata; Manufacturer Part Number: BLM18SG221TN1D; Material: Ferrite,Steel; Tolerance: 25%; Max Current Rating: 2.5A; Number of Lines: 1; DC Resistance (DCR): 40mR; Test Frequency: 100MHz; Supplier 1: Digi-Key; RoHS: Yes; Category: Inductors; Stock 1: 123623; Pricing 1: 1=0,14000, 10=0,11600, 25=0,09040, 50=0,07500, 100=0,06460, 250=0,05172, 500=0,04654, 1000=0,03878, 5000=0,03619 (USD); Case/Package: 0603; Number of Pins: 2; Weight: 7.1E-05oz; Core Material: Ferrite; Case Code (Metric): 1608; Case Code (Imperial): 0603; Min Operating Temperature: -55°C; Max Operating Temperature: 125°C; Package Quantity: 1; Impedance: 220R; Packaging: Tape and Reel; Current Rating: 2.5A; Termination: SMD/SMT; Max DC Current: 2.5A; DC Current: 2.5A; Number of Circuits: 1; Length: 1.6mm; Height: 0.8mm; Width: 0.8mm; Depth: 0.95mm; Radiation Hardening: No; REACH SVHC: No SVHC; Lead Free: Lead Free; ComponentLink1URL: https://datasheet.ciiva.com/1561/c31e-1561456.pdf?src-supplier=Newark; ComponentLink1Description: https://datasheet.ciiva.com/1561/c31e-1561456.pdf?src-supplier=Newark; ComponentLink2URL: https://datasheet.ciiva.com/41449/001171724-da-01-en-chip-drossel0603-220r-2500ma-1-6x0-8mm-41449352.pdf?src-supplier=Conrad; ComponentLink2Description: https://datasheet.ciiva.com/41449/001171724-da-01-en-chip-drossel0603-220r-2500ma-1-6x0-8mm-41449352.pdf?src-supplier=Conrad; ComponentLink3URL: https://datasheet.ciiva.com/41449/001172313-da-01-en-drossel-0603-220r-21-6x0-8mm-10000st-41449677.pdf?src-supplier=Conrad; ComponentLink3Description: https://datasheet.ciiva.com/41449/001172313-da-01-en-drossel-0603-220r-21-6x0-8mm-10000st-41449677.pdf?src-supplier=Conrad; ComponentLink4URL: https://datasheet.ciiva.com/1012/l0110s0100blm18s-1012626.pdf?src-supplier=Digi-Key; ComponentLink4Description: https://datasheet.ciiva.com/1012/l0110s0100blm18s-1012626.pdf?src-supplier=Digi-Key; ComponentLink5URL: https://datasheet.ciiva.com/1012/l0110s0100blm18s-1012627.pdf?src-supplier=Digi-Key; ComponentLink5Description: https://datasheet.ciiva.com/1012/l0110s0100blm18s-1012627.pdf?src-supplier=Digi-Key; ComponentLink6URL: https://datasheet.ciiva.com/1012/l0110s0100blm18s-1012628.pdf?src-supplier=Digi-Key; ComponentLink6Description: https://datasheet.ciiva.com/1012/l0110s0100blm18s-1012628.pdf?src-supplier=Digi-Key; ComponentLink7URL: https://datasheet.ciiva.com/17279/l0110s0100blm18s-17279573.pdf?src-supplier=Avnet+Europe; ComponentLink7Description: https://datasheet.ciiva.com/17279/l0110s0100blm18s-17279573.pdf?src-supplier=Avnet+Europe; ComponentLink8URL: https://datasheet.ciiva.com/8508/l0110s0100blm18s-8508310.pdf?src-supplier=Avnet; ComponentLink8Description: https://datasheet.ciiva.com/8508/l0110s0100blm18s-8508310.pdf?src-supplier=Avnet; ComponentLink9URL: https://datasheet.ciiva.com/8021/5151-8021517.pdf?src-supplier=Element14; ComponentLink9Description: https://datasheet.ciiva.com/8021/5151-8021517.pdf?src-supplier=Element14; ComponentLink10URL: https://datasheet.ciiva.com/16204/l0110s0100blm18s-16204029.pdf?src-supplier=Future+Electronics; ComponentLink10Description: https://datasheet.ciiva.com/16204/l0110s0100blm18s-16204029.pdf?src-supplier=Future+Electronics; ComponentLink11URL: https://datasheet.ciiva.com/14122/blm-series-eng-tds-14122910.pdf?src-supplier=Distrelec; ComponentLink11Description: https://datasheet.ciiva.com/14122/blm-series-eng-tds-14122910.pdf?src-supplier=Distrelec; ComponentLink12URL: https://datasheet.ciiva.com/8021/5151-8021519.pdf?src-supplier=Element14; ComponentLink12Description: https://datasheet.ciiva.com/8021/5151-8021519.pdf?src-supplier=Element14
  FB36: Supplier Part Number 1: 490-5225-1-ND
R738-R743 = Resistor: PANASONIC - ERJ-2RKF1001X - SMD Chip Resistor, 0402 [1005 Metric], 1 kohm, ERJ2R Series, 50 V, Thick Film, 100 mW; Temperature Coefficient: 100ppm/°C; Tolerance: 1%; Voltage Rating (DC): 50V; Power Rating: 100mW; Supplier 1: Digi-Key; Supplier Part Number 1: P1.00KLDKR-ND; Manufacturer: Panasonic; Manufacturer Part Number: ERJ-2RKF1001X; RoHS: Yes; Category: Chip SMD Resistors; Stock 1: 1864188; Pricing 1: 1=0,10000, 10=0,04300, 100=0,01740, 1000=0,00782, 2500=0,00678, 5000=0,00561 (USD); Mount: Surface Mount; Case/Package: 0402; Number of Pins: 2; Contact Plating: Tin; Case Code (Imperial): 0402; Case Code (Metric): 1005; Min Operating Temperature: -55°C; Max Operating Temperature: 155°C; Composition: Thick Film; Resistance: 1kR; Termination: SMD/SMT; Number of Terminations: 2; Military Standard: Not; Features: Automotive AEC-Q200; Packaging: Tape and Reel; Voltage Rating: 50V; Package Quantity: 1; Max Power Dissipation: 100mW; Working Voltage: 50V; Length: 1mm; Height: 0.35mm; Depth: 0.5mm; Width: 0.5mm; Radiation Hardening: No; Lead Free: Lead Free; REACH SVHC: No SVHC; ComponentLink1URL: https://datasheet.ciiva.com/11821/0900766b80f80784-11821203.pdf?src-supplier=RSComponents; ComponentLink1Description: https://datasheet.ciiva.com/11821/0900766b80f80784-11821203.pdf?src-supplier=RSComponents; ComponentLink2URL: https://datasheet.ciiva.com/7942/aoa0000ce2-7942426.pdf?src-supplier=Element14; ComponentLink2Description: https://datasheet.ciiva.com/7942/aoa0000ce2-7942426.pdf?src-supplier=Element14; ComponentLink3URL: https://datasheet.ciiva.com/16523/aoa0000ce2-16523834.pdf?src-supplier=Avnet+Asia; ComponentLink3Description: https://datasheet.ciiva.com/16523/aoa0000ce2-16523834.pdf?src-supplier=Avnet+Asia; ComponentLink4URL: https://datasheet.ciiva.com/17215/aoa0000ce2-17215308.pdf?src-supplier=Avnet+Europe; ComponentLink4Description: https://datasheet.ciiva.com/17215/aoa0000ce2-17215308.pdf?src-supplier=Avnet+Europe; ComponentLink5URL: https://datasheet.ciiva.com/22673/1678782-22673916.pdf?src-supplier=Element14; ComponentLink5Description: https://datasheet.ciiva.com/22673/1678782-22673916.pdf?src-supplier=Element14; ComponentLink6URL: https://datasheet.ciiva.com/28532/1678782-28532109.pdf?src-supplier=Element14; ComponentLink6Description: https://datasheet.ciiva.com/28532/1678782-28532109.pdf?src-supplier=Element14; ComponentLink7URL: https://datasheet.ciiva.com/16767/70260748-16767559.pdf?src-supplier=Allied+Electronics; ComponentLink7Description: https://datasheet.ciiva.com/16767/70260748-16767559.pdf?src-supplier=Allied+Electronics; ComponentLink8URL: https://datasheet.ciiva.com/9198/aoa0000ce2-9198920.pdf?src-supplier=Avnet; ComponentLink8Description: https://datasheet.ciiva.com/9198/aoa0000ce2-9198920.pdf?src-supplier=Avnet; ComponentLink9URL: https://datasheet.ciiva.com/16771/70260748-16771979.pdf?src-supplier=Allied+Electronics; ComponentLink9Description: https://datasheet.ciiva.com/16771/70260748-16771979.pdf?src-supplier=Allied+Electronics
U12-U14 = LTC6952: Dystrybutor Zegarów; Manufacturer: Analog Devices; Manufacturer Part Number: LTC6952IUKG#PBF; Supplier 1: Digi-Key; Stock 1: 267; Pricing 1: 1 = 30,78000, 25 = 24,62680, 100 = 21,36000, 250 = 20,50564, 500 = 19,86492 (USD); RoHS: No; Number of Pins: 52
U16 = LMK05028: Manufacturer Part Number: LMK05028RGCR; Manufacturer: Texas Instruments; Number of Inputs: 4; Number of Outputs: 8; Supplier 1: Digi-Key; Supplier 2: Digi-Key; Supplier 3: Mouser; Supplier Part Number 1: 296-49099-1-ND; Supplier Part Number 2: 296-49099-6-ND; Supplier Part Number 3: 595-LMK05028RGCT; Stock 1: 230; Pricing 1: 1 = 32,36000, 10 = 29,84800, 100 = 25,48800 (USD); RoHS: No; ComponentLink1URL: http://www.ti.com/lit/ds/symlink/lmk05028.pdf?src-supplier=Digi-Key; ComponentLink1Description: http://www.ti.com/lit/ds/symlink/lmk05028.pdf?src-supplier=Digi-Key